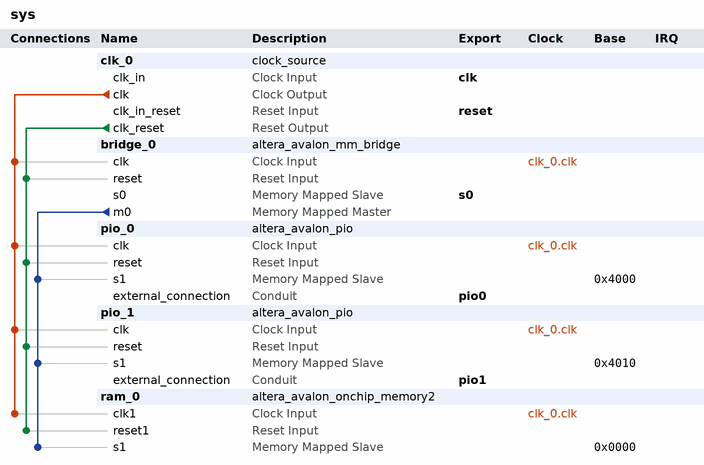
[diagram p0: system contents]
# Platform Designer (Qsys) system sys, Cyclone V 5CSEMA5F31C6
# Parameters at their usual value, and those the tool derives, are not listed.
package require -exact qsys 25.1
create_system sys
set_project_property DEVICE_FAMILY {Cyclone V}
set_project_property DEVICE 5CSEMA5F31C6

add_instance clk_0 clock_source 25.1
set_instance_parameter_value clk_0 clockFrequency 50000000

add_instance bridge_0 altera_avalon_mm_bridge 25.1
set_instance_parameter_value bridge_0 ADDRESS_UNITS SYMBOLS
set_instance_parameter_value bridge_0 ADDRESS_WIDTH 16
set_instance_parameter_value bridge_0 DATA_WIDTH 32
set_instance_parameter_value bridge_0 MAX_PENDING_RESPONSES 4
set_instance_parameter_value bridge_0 USE_AUTO_ADDRESS_WIDTH 0

add_instance pio_0 altera_avalon_pio 25.1
set_instance_parameter_value pio_0 direction Output
set_instance_parameter_value pio_0 width 8

add_instance pio_1 altera_avalon_pio 25.1
set_instance_parameter_value pio_1 direction Output
set_instance_parameter_value pio_1 width 16

add_instance ram_0 altera_avalon_onchip_memory2 25.1
set_instance_parameter_value ram_0 dataWidth 32
set_instance_parameter_value ram_0 dualPort false
set_instance_parameter_value ram_0 initMemContent true
set_instance_parameter_value ram_0 initializationFileName onchip_mem.hex
set_instance_parameter_value ram_0 memorySize 8192

# connections
add_connection clk_0.clk bridge_0.clk clock
add_connection clk_0.clk pio_0.clk clock
add_connection clk_0.clk pio_1.clk clock
add_connection clk_0.clk ram_0.clk1 clock
add_connection clk_0.clk_reset bridge_0.reset reset
add_connection clk_0.clk_reset pio_0.reset reset
add_connection clk_0.clk_reset pio_1.reset reset
add_connection clk_0.clk_reset ram_0.reset1 reset
add_connection bridge_0.m0 pio_0.s1 avalon
set_connection_parameter_value bridge_0.m0/pio_0.s1 baseAddress 0x4000
add_connection bridge_0.m0 pio_1.s1 avalon
set_connection_parameter_value bridge_0.m0/pio_1.s1 baseAddress 0x4010
add_connection bridge_0.m0 ram_0.s1 avalon
set_connection_parameter_value bridge_0.m0/ram_0.s1 baseAddress 0x0000

# exported interfaces
add_interface clk clock sink
set_interface_property clk EXPORT_OF clk_0.clk_in
add_interface pio0 conduit end
set_interface_property pio0 EXPORT_OF pio_0.external_connection
add_interface pio1 conduit end
set_interface_property pio1 EXPORT_OF pio_1.external_connection
add_interface reset reset sink
set_interface_property reset EXPORT_OF clk_0.clk_in_reset
add_interface s0 avalon slave
set_interface_property s0 EXPORT_OF bridge_0.s0

set_interconnect_requirement {$system} qsys_mm.clockCrossingAdapter HANDSHAKE
set_interconnect_requirement {$system} qsys_mm.enableEccProtection FALSE
set_interconnect_requirement {$system} qsys_mm.insertDefaultSlave FALSE
set_interconnect_requirement {$system} qsys_mm.maxAdditionalLatency 1

save_system sys.qsys
